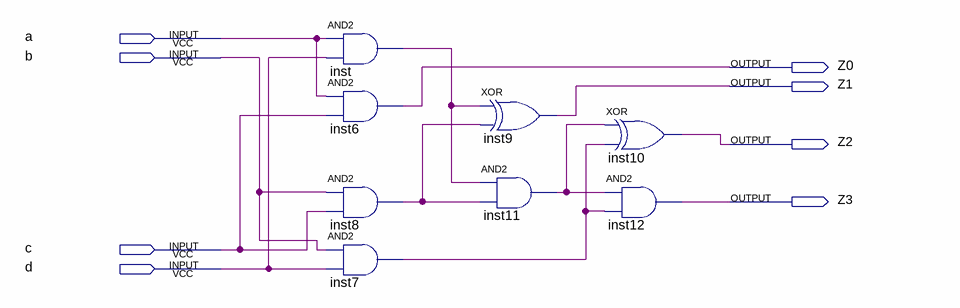
[diagram p0: schematic sheet]
// Quartus schematic division.bdf as structural Verilog: 8 symbols, 8 pins
module division (
  input  a,
  input  b,
  input  c,
  input  d,
  output Z0,
  output Z1,
  output Z2,
  output Z3
);

  wire inst7_out, inst8_out, inst11_out, inst_out;

  and inst (inst_out, a, d);
  and inst6 (Z0, a, c);
  and inst8 (inst8_out, b, c);
  and inst7 (inst7_out, b, d);
  xor inst9 (Z1, inst_out, inst8_out);
  and inst11 (inst11_out, inst_out, inst8_out);
  xor inst10 (Z2, inst11_out, inst7_out);
  and inst12 (Z3, inst11_out, inst7_out);
endmodule
